# Altium schematic sheet IMU_Sensor_Sheet.SchDoc
size A4; SheetNumber: 4; SheetTotal: 4
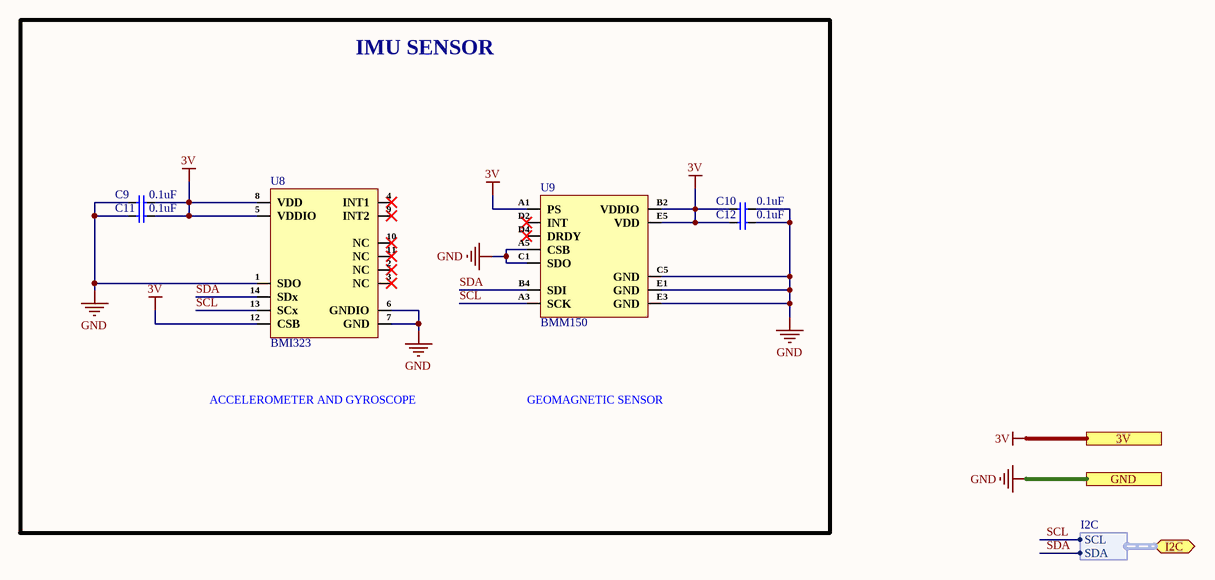
[diagram p0: IMU_Sensor_Sheet.SchDoc]

## Parts
C9  0.1uF  [CAP-0201]
C10  0.1uF  [CAP-0201]
C11  0.1uF  [CAP-0201]
C12  0.1uF  [CAP-0201]
U8  BMI323  [14-LGA (2.5x3)]
U9  BMM150  [12-WLCSP (1.56x1.56)]

## Blocks framed on the sheet
IMU SENSOR: C9-C12 U8 U9

## Ports
3V, GND, I2C (bidir, harness I2C)

## Harnesses
I2C: SDA, SCL

## Nets
3V: C9.2 C10.2 C11.2 C12.2 U8.5(VDDIO) U8.8(VDD) U8.12(CSB) U9.A1(PS) U9.B2(VDDIO) U9.E5(VDD) ; port 3V
GND: C9.1 C10.1 C11.1 C12.1 U8.1(SDO) U8.6(GNDIO) U8.7(GND) U9.A5(CSB) U9.C1(SDO) U9.C5(GND) U9.E1(GND) U9.E3(GND) ; port GND
SCL: U8.13(SCx) U9.A3(SCK) ; port I2C.SCL
SDA: U8.14(SDx) U9.B4(SDI) ; port I2C.SDA

Not connected (* = marked no-connect by the designer): U8 2(NC)* 3(NC)* 4(INT1)* 9(INT2)* 10(NC)* 11(NC)*; U9 D2(INT)* D4(DRDY)*

## Notes on the sheet
- ACCELEROMETER AND GYROSCOPE
- GEOMAGNETIC SENSOR
- File:
- Title:
- Date:
- Page
- Num:
- Total:
- Drawn By: Huzaifa Ali

## Library data of the parts
C9-C12 = CC0201KRX5R6BB104: CAP CER 0.1UF 10V X5R 0201; Manufacturer: Yageo; Capacitance: 100nF; Tolerance: 10%; Supplier 1: Mouser; Manufacturer Part Number: CC0201KRX5R6BB104; RoHS: Yes; Category: Ceramic Capacitors; Stock 1: 824403; Pricing 1: 1=0.10000, 10=0.02400, 50=0.02400, 100=0.01900, 1000=0.01100, 10000=0.00900 (USD); Mount: Surface Mount; Case/Package: 0201; Case Code (Imperial): 0201; Case Code (Metric): 0603; Weight: 6E-06oz; Min Operating Temperature: -55°C; Max Operating Temperature: 85°C; Dielectric: X5R; Voltage Rating (DC): 10V; Packaging: Tape and Reel; Termination: SMD/SMT; Resistor Type: Ceramic; Voltage Rating: 10V; Series: CC; Construction: Flat; Length: 0.6mm; Width: 0.012inch; Height: 0.3mm; Thickness: 0.013inch; Depth: 0.3mm; Radiation Hardening: No; Lead Free: Lead Free; Halogen Free: Halogen Free; RoHS Compliant: Yes; ComponentLink1URL: https://datasheet.ciiva.com/11587/upy-gphc-x5r-4v-to-50v-12-11587190.pdf?src-supplier=Avnet; ComponentLink1Description: https://datasheet.ciiva.com/11587/upy-gphc-x5r-4v-to-50v-12-11587190.pdf?src-supplier=Avnet; Supplier Part Number 1: 603-CC201KRX5R6BB104; LCSC Part Number: C190183
U8 = BMI323: IMU ACCEL/GYRO I2C/SPI 14LGA; Manufacturer: Bosch Sensortec; Item Type: IC; Supplier: Future Electronics; Supplier Part Number: 1168362; Manufacturer Part Number: BMI323; RoHS: No; Category: Uncategorized; LCSC Part Number: C5368700
U9 = BMM150: SENSOR FLIPCORE/HALL SPI 12WLCSP; Manufacturer: Bosch Sensortec; Item Type: IC; Supplier: Rs; Supplier Part Number: 2457371; Manufacturer Part Number: BMM150; RoHS: Yes; Category: Magnetic Sensors; Stock: 780; Pricing: 5=1.686, 25=1.598, 100=1.49, 500=1.37, 1000=1.262 (GBP); ComponentLink1URL: https://datasheet.ciiva.com/18575/bst-bmm150-ds001-01-18575453.pdf?src-supplier=Digi-Key; ComponentLink1Description: https://datasheet.ciiva.com/18575/bst-bmm150-ds001-01-18575453.pdf?src-supplier=Digi-Key; LCSC Part Number: C171681